# Altium schematic sheet PT1000.SchDoc
size A3; SheetNumber: 5; SheetTotal: 9
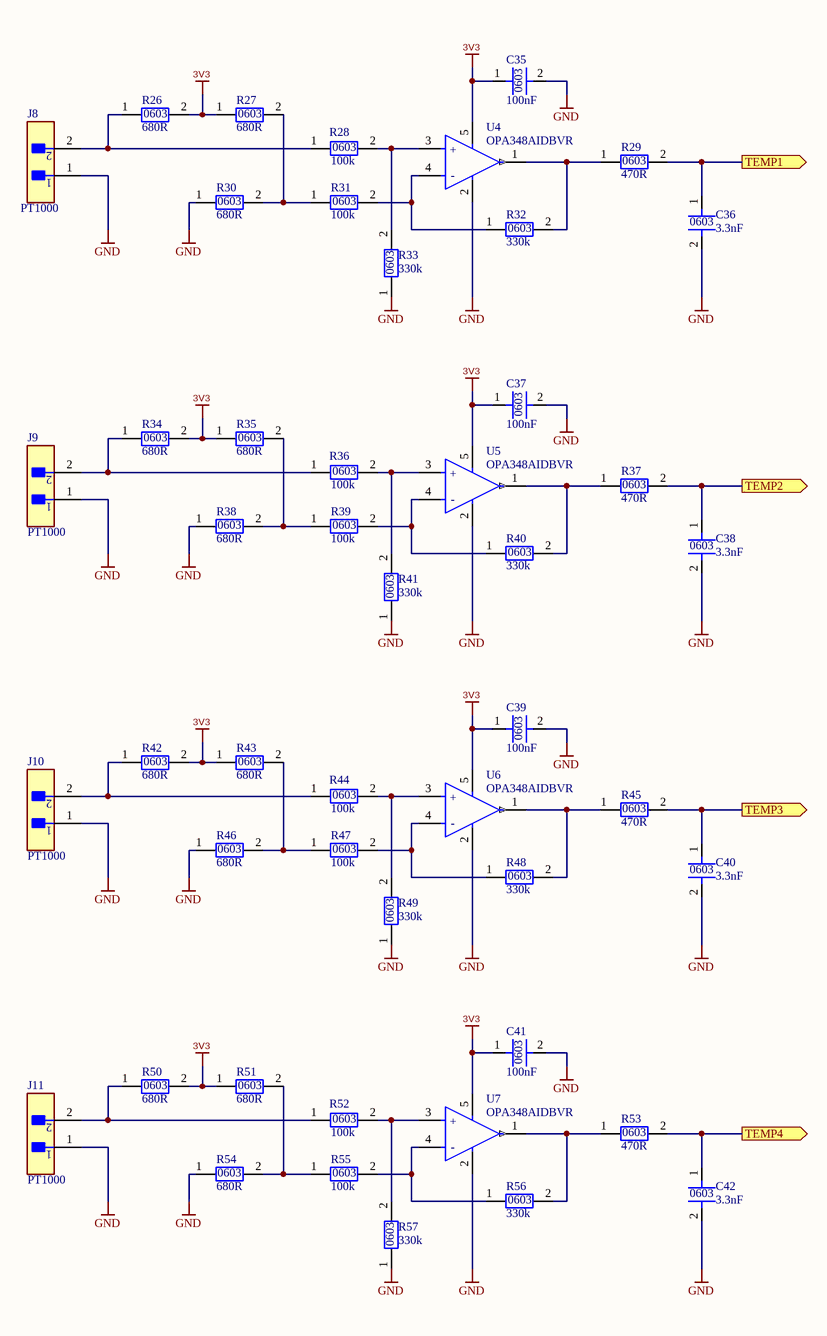
[diagram p0: PT1000.SchDoc]

## Parts
C35  SMD 0603 Capacitor  [CAPACITOR_SMD_0603]  (value not drawn)
C36  SMD 0603 Capacitor  [CAPACITOR_SMD_0603]  (value not drawn)
C37  SMD 0603 Capacitor  [CAPACITOR_SMD_0603]  (value not drawn)
C38  SMD 0603 Capacitor  [CAPACITOR_SMD_0603]  (value not drawn)
C39  SMD 0603 Capacitor  [CAPACITOR_SMD_0603]  (value not drawn)
C40  SMD 0603 Capacitor  [CAPACITOR_SMD_0603]  (value not drawn)
C41  SMD 0603 Capacitor  [CAPACITOR_SMD_0603]  (value not drawn)
C42  SMD 0603 Capacitor  [CAPACITOR_SMD_0603]  (value not drawn)
J8  B2B-XH-A(LF)(SN)  [FP-B2B-XH-A_LF_SN-MFG]  (value not drawn)
J9  B2B-XH-A(LF)(SN)  [FP-B2B-XH-A_LF_SN-MFG]  (value not drawn)
J10  B2B-XH-A(LF)(SN)  [FP-B2B-XH-A_LF_SN-MFG]  (value not drawn)
J11  B2B-XH-A(LF)(SN)  [FP-B2B-XH-A_LF_SN-MFG]  (value not drawn)
R26  SMD 0603 Resistor  [RESISTOR_SMD_0603]  (value not drawn)
R27  SMD 0603 Resistor  [RESISTOR_SMD_0603]  (value not drawn)
R28  SMD 0603 Resistor  [RESISTOR_SMD_0603]  (value not drawn)
R29  SMD 0603 Resistor  [RESISTOR_SMD_0603]  (value not drawn)
R30  SMD 0603 Resistor  [RESISTOR_SMD_0603]  (value not drawn)
R31  SMD 0603 Resistor  [RESISTOR_SMD_0603]  (value not drawn)
R32  SMD 0603 Resistor  [RESISTOR_SMD_0603]  (value not drawn)
R33  SMD 0603 Resistor  [RESISTOR_SMD_0603]  (value not drawn)
R34  SMD 0603 Resistor  [RESISTOR_SMD_0603]  (value not drawn)
R35  SMD 0603 Resistor  [RESISTOR_SMD_0603]  (value not drawn)
R36  SMD 0603 Resistor  [RESISTOR_SMD_0603]  (value not drawn)
R37  SMD 0603 Resistor  [RESISTOR_SMD_0603]  (value not drawn)
R38  SMD 0603 Resistor  [RESISTOR_SMD_0603]  (value not drawn)
R39  SMD 0603 Resistor  [RESISTOR_SMD_0603]  (value not drawn)
R40  SMD 0603 Resistor  [RESISTOR_SMD_0603]  (value not drawn)
R41  SMD 0603 Resistor  [RESISTOR_SMD_0603]  (value not drawn)
R42  SMD 0603 Resistor  [RESISTOR_SMD_0603]  (value not drawn)
R43  SMD 0603 Resistor  [RESISTOR_SMD_0603]  (value not drawn)
R44  SMD 0603 Resistor  [RESISTOR_SMD_0603]  (value not drawn)
R45  SMD 0603 Resistor  [RESISTOR_SMD_0603]  (value not drawn)
R46  SMD 0603 Resistor  [RESISTOR_SMD_0603]  (value not drawn)
R47  SMD 0603 Resistor  [RESISTOR_SMD_0603]  (value not drawn)
R48  SMD 0603 Resistor  [RESISTOR_SMD_0603]  (value not drawn)
R49  SMD 0603 Resistor  [RESISTOR_SMD_0603]  (value not drawn)
R50  SMD 0603 Resistor  [RESISTOR_SMD_0603]  (value not drawn)
R51  SMD 0603 Resistor  [RESISTOR_SMD_0603]  (value not drawn)
R52  SMD 0603 Resistor  [RESISTOR_SMD_0603]  (value not drawn)
R53  SMD 0603 Resistor  [RESISTOR_SMD_0603]  (value not drawn)
R54  SMD 0603 Resistor  [RESISTOR_SMD_0603]  (value not drawn)
R55  SMD 0603 Resistor  [RESISTOR_SMD_0603]  (value not drawn)
R56  SMD 0603 Resistor  [RESISTOR_SMD_0603]  (value not drawn)
R57  SMD 0603 Resistor  [RESISTOR_SMD_0603]  (value not drawn)
U4  OPA348AIDBVR  [FP-DBV0005A-IPC_A]
U5  OPA348AIDBVR  [FP-DBV0005A-IPC_A]
U6  OPA348AIDBVR  [FP-DBV0005A-IPC_A]
U7  OPA348AIDBVR  [FP-DBV0005A-IPC_A]

## Ports
TEMP1 (out, see MAIN_SCHEMATIC[2C], STM32[2A]), TEMP2 (out, see MAIN_SCHEMATIC[2C], STM32[2A]), TEMP3 (out, see MAIN_SCHEMATIC[2C], STM32[2B]), TEMP4 (out, see MAIN_SCHEMATIC[2D], STM32[2B])

## Nets
3V3: C35.1 C37.1 C39.1 C41.1 R26.2 R27.1 R34.2 R35.1 R42.2 R43.1 R50.2 R51.1 U4.5(V+) U5.5(V+) U6.5(V+) U7.5(V+)
GND: C35.2 C36.2 C37.2 C38.2 C39.2 C40.2 C41.2 C42.2 J8.1 J9.1 J10.1 J11.1 R30.1 R33.1 R38.1 R41.1 R46.1 R49.1 R54.1 R57.1 U4.2(V-) U5.2(V-) U6.2(V-) U7.2(V-)
TEMP1: C36.1 R29.2 ; port TEMP1
TEMP2: C38.1 R37.2 ; port TEMP2
TEMP3: C40.1 R45.2 ; port TEMP3
TEMP4: C42.1 R53.2 ; port TEMP4
NetJ8_2: J8.2 R26.1 R28.1
NetJ9_2: J9.2 R34.1 R36.1
NetJ10_2: J10.2 R42.1 R44.1
NetJ11_2: J11.2 R50.1 R52.1
NetR27_2: R27.2 R30.2 R31.1
NetR28_2: R28.2 R33.2 U4.3(+IN)
NetR29_1: R29.1 R32.2 U4.1(OUT)
NetR31_2: R31.2 R32.1 U4.4(-IN)
NetR35_2: R35.2 R38.2 R39.1
NetR36_2: R36.2 R41.2 U5.3(+IN)
NetR37_1: R37.1 R40.2 U5.1(OUT)
NetR39_2: R39.2 R40.1 U5.4(-IN)
NetR43_2: R43.2 R46.2 R47.1
NetR44_2: R44.2 R49.2 U6.3(+IN)
NetR45_1: R45.1 R48.2 U6.1(OUT)
NetR47_2: R47.2 R48.1 U6.4(-IN)
NetR51_2: R51.2 R54.2 R55.1
NetR52_2: R52.2 R57.2 U7.3(+IN)
NetR53_1: R53.1 R56.2 U7.1(OUT)
NetR55_2: R55.2 R56.1 U7.4(-IN)

## Notes on the sheet
- (near C35) 100nF
- (near R26) 680R
- (near R27) 680R
- (near R28) 100k
- (near R29) 470R
- (near J8) PT1000
- (near R30) 680R
- (near R31) 100k
- (near R32) 330k
- (near C36) 3.3nF
- (near R33) 330k
- (near R34) 680R
- (near R35) 680R
- (near C37) 100nF
- (near R36) 100k
- (near R37) 470R
- (near J9) PT1000
- (near R38) 680R
- (near R39) 100k
- (near R41) 330k
- (near R40) 330k
- (near C38) 3.3nF
- (near R42) 680R
- (near R43) 680R
- (near C39) 100nF
- (near J10) PT1000
- (near R46) 680R
- (near R47) 100k
- (near R44) 100k
- (near R45) 470R
- (near R49) 330k
- (near R48) 330k
- (near C40) 3.3nF
- (near R50) 680R
- (near R51) 680R
- (near R52) 100k
- (near C41) 100nF
- (near J11) PT1000
- (near R54) 680R
- (near R55) 100k
- (near R53) 470R
- (near R57) 330k
- (near R56) 330k
- (near C42) 3.3nF
- (in symbol CMP-0272-00993-4) +; -
- (in symbol SMD 0603 Capacitor) 0603
- (in symbol SMD 0603 Resistor) 0603

## Library data of the parts
C35-C42 = SMD 0603 Capacitor: 0603 capacitor
J8-J11 = CMP-2000-05888-3: CONN HEADER VERT 2POS 2.5MM; Current Rating: 3A; Voltage Rating: 250V; Number of Contacts: 2; Contact Resistance: 20mR; Wire/Cable Gauge: 22AWG; Insulation Resistance: 1GR; Connector Type: Male Pin; Packaging: Bulk; Contact Material: Brass; Lead Free: Lead Free; Orientation: Straight; Contact Plating: Tin; Max Current Rating: 3A; Termination: Solder; Fastening Type: Detent; Depth: 5.75mm; Housing Material: Polyamide; REACH SVHC: No SVHC; Series: XH; Voltage Rating (AC): 250V; Number of Positions: 2; Color: Natural; Contact Type: Male Pin; Max Voltage Rating (DC): 250V; Pitch: 2.5mm; Lead Pitch: 2.5mm; Mount: Through Hole; Max Operating Temperature: 85°C; Length: 7.4mm; Max Voltage Rating (AC): 250V; Min Operating Temperature: -25°C; Number of Rows: 1; Housing Color: White
R26-R57 = SMD 0603 Resistor: 0603 resistor
U4-U7 = CMP-0272-00993-4: IC OPAMP GP 1 CIRCUIT SOT23-5; Output Current per Channel: 10mA; Input Bias Current: 10pA; Number of Circuits: 1; Nominal Supply Current: 65uA; Voltage Gain: 108dB; Bandwidth: 1MHz; Max Supply Voltage: 5.5V; Input Offset Voltage (Vos): 5mV; Slew Rate: 0.5V/µs; Power Supply Rejection Ratio (PSRR): 84.44dB; Common Mode Rejection Ratio: 70dB; Operating Supply Current: 45uA; Min Supply Voltage: 2.5V; Number of Pins: 5; Length: 2.9mm; Min Operating Temperature: -40°C; Number of Channels: 1; Case/Package: SOT-23; Number of Elements: 1; Package Quantity: 3000; Max I/O Voltage: 5mV; Gain Bandwidth Product: 1MHz; Contact Plating: Gold; Number of Amplifiers: 1; Lead Free: Lead Free; REACH SVHC: No SVHC; Nominal Gain Bandwidth Product: 1MHz; Width: 1.6mm; Radiation Hardening: No; Height: 1.15mm; Packaging: Tape and Reel; Unity Gain Bandwidth Product: 1MHz; Max Operating Temperature: 125°C